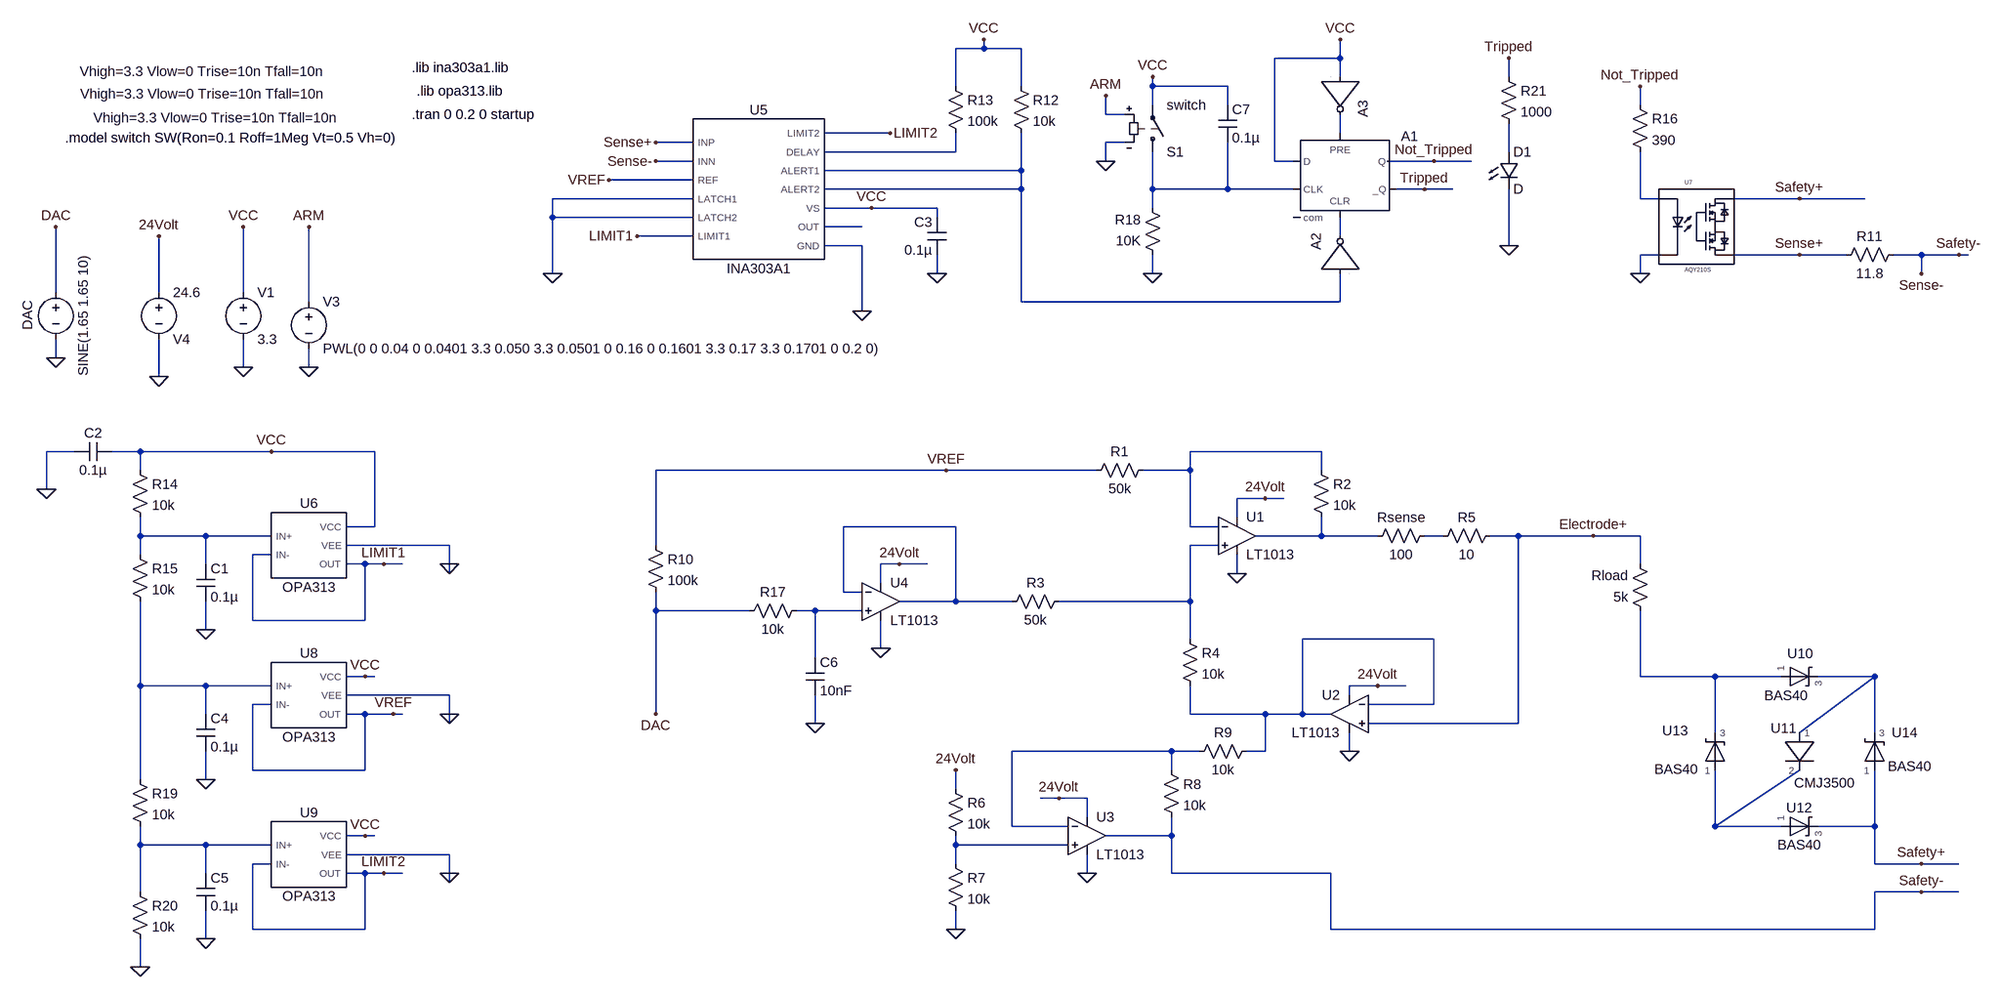
[diagram p0: schematic combined_analog.asc]
combined_analog.asc, the LTspice schematic file:
Version 4.1
SHEET 1 1880 880
WIRE -160 -768 -160 -784
WIRE -160 -768 -208 -768
WIRE -96 -768 -160 -768
WIRE 448 -752 448 -784
WIRE 448 -752 336 -752
WIRE 448 -720 448 -752
WIRE 736 -720 736 -752
WIRE -208 -704 -208 -768
WIRE -96 -704 -96 -768
WIRE 128 -704 128 -720
WIRE 256 -704 128 -704
WIRE 128 -672 128 -704
WIRE 256 -672 256 -704
WIRE 960 -672 960 -704
WIRE 48 -656 48 -688
WIRE 80 -656 48 -656
WIRE -320 -624 -432 -624
WIRE 448 -624 448 -656
WIRE -656 -608 -720 -608
WIRE 80 -608 48 -608
WIRE -208 -592 -208 -624
WIRE -208 -592 -432 -592
WIRE 736 -592 736 -640
WIRE -656 -576 -720 -576
WIRE 48 -576 48 -608
WIRE 336 -576 336 -752
WIRE 368 -576 336 -576
WIRE 608 -576 528 -576
WIRE 672 -576 608 -576
WIRE -96 -560 -96 -624
WIRE -96 -560 -432 -560
WIRE -656 -544 -800 -544
WIRE -96 -528 -96 -560
WIRE -96 -528 -432 -528
WIRE 128 -528 128 -592
WIRE 256 -528 256 -608
WIRE 256 -528 128 -528
WIRE 368 -528 256 -528
WIRE 592 -528 544 -528
WIRE 640 -528 592 -528
WIRE -656 -512 -896 -512
WIRE 960 -512 960 -592
WIRE 992 -512 960 -512
WIRE 1232 -512 1120 -512
WIRE 1344 -512 1232 -512
WIRE -352 -496 -432 -496
WIRE -240 -496 -352 -496
WIRE 128 -496 128 -528
WIRE -896 -480 -896 -512
WIRE -656 -480 -896 -480
WIRE -240 -480 -240 -496
WIRE -368 -464 -432 -464
WIRE -656 -448 -752 -448
WIRE 448 -448 448 -480
WIRE -368 -432 -432 -432
WIRE 736 -432 736 -528
WIRE 992 -416 960 -416
WIRE 1232 -416 1120 -416
WIRE 1312 -416 1232 -416
WIRE 1440 -416 1392 -416
WIRE 1504 -416 1440 -416
WIRE 1520 -416 1504 -416
WIRE -896 -384 -896 -480
WIRE -240 -384 -240 -416
WIRE 128 -384 128 -416
WIRE 960 -384 960 -416
WIRE 1440 -384 1440 -416
WIRE -1744 -352 -1744 -464
WIRE -1568 -352 -1568 -448
WIRE -1424 -352 -1424 -464
WIRE -1312 -336 -1312 -464
WIRE -96 -336 -96 -528
WIRE 448 -336 448 -384
WIRE 448 -336 -96 -336
WIRE -368 -320 -368 -432
WIRE -1744 -240 -1744 -272
WIRE -1424 -224 -1424 -272
WIRE -1312 -224 -1312 -256
WIRE -1568 -208 -1568 -272
WIRE -1712 -80 -1760 -80
WIRE -1600 -80 -1648 -80
WIRE -1376 -80 -1600 -80
WIRE -1200 -80 -1376 -80
WIRE 416 -80 192 -80
WIRE -1600 -48 -1600 -80
WIRE -224 -48 -720 -48
WIRE 32 -48 -224 -48
WIRE 192 -48 192 -80
WIRE 192 -48 112 -48
WIRE 416 -48 416 -80
WIRE -1760 -16 -1760 -80
WIRE 320 0 272 0
WIRE 352 0 320 0
WIRE 272 32 272 0
WIRE -1200 48 -1200 -80
WIRE -1200 48 -1248 48
WIRE -208 48 -400 48
WIRE 192 48 192 -48
WIRE 240 48 192 48
WIRE -1600 64 -1600 32
WIRE -1488 64 -1600 64
WIRE -1376 64 -1488 64
WIRE 416 64 416 32
WIRE 416 64 304 64
WIRE 512 64 416 64
WIRE 624 64 592 64
WIRE 752 64 704 64
WIRE 880 64 752 64
WIRE 960 64 880 64
WIRE -1072 80 -1248 80
WIRE -720 80 -720 -48
WIRE 240 80 192 80
WIRE -1600 96 -1600 64
WIRE -1376 96 -1408 96
WIRE -1488 112 -1488 64
WIRE -1216 112 -1248 112
WIRE -1184 112 -1216 112
WIRE -1152 112 -1184 112
WIRE -1072 112 -1072 80
WIRE -304 112 -336 112
WIRE -256 112 -304 112
WIRE 960 112 960 64
WIRE -1072 128 -1072 112
WIRE 272 128 272 96
WIRE -336 144 -336 112
WIRE -400 160 -400 48
WIRE -368 160 -400 160
WIRE -208 176 -208 48
WIRE -208 176 -304 176
WIRE -112 176 -208 176
WIRE 192 176 192 80
WIRE 192 176 -32 176
WIRE -720 192 -720 160
WIRE -560 192 -720 192
WIRE -448 192 -480 192
WIRE -368 192 -448 192
WIRE -1408 208 -1408 96
WIRE -1216 208 -1216 112
WIRE -1216 208 -1408 208
WIRE -1488 224 -1488 176
WIRE 192 240 192 176
WIRE 608 240 384 240
WIRE -336 256 -336 208
WIRE -448 272 -448 192
WIRE -1216 304 -1248 304
WIRE -1200 304 -1216 304
WIRE 960 304 960 192
WIRE 1088 304 960 304
WIRE 1200 304 1088 304
WIRE 1360 304 1264 304
WIRE -1600 320 -1600 176
WIRE -1488 320 -1600 320
WIRE -1376 320 -1488 320
WIRE 512 320 464 320
WIRE 560 320 512 320
WIRE -1072 336 -1248 336
WIRE 464 336 464 320
WIRE -1376 352 -1408 352
WIRE 608 352 608 240
WIRE 608 352 496 352
WIRE -1488 368 -1488 320
WIRE -1216 368 -1248 368
WIRE -1168 368 -1216 368
WIRE -1152 368 -1168 368
WIRE -1072 368 -1072 336
WIRE -720 368 -720 192
WIRE 192 368 192 320
WIRE 320 368 192 368
WIRE 384 368 384 240
WIRE 384 368 320 368
WIRE 432 368 384 368
WIRE -1072 384 -1072 368
WIRE -448 384 -448 336
WIRE 752 384 752 64
WIRE 752 384 496 384
WIRE 1088 400 1088 304
WIRE 1232 400 1360 304
WIRE 1360 400 1360 304
WIRE 160 432 -112 432
WIRE 208 432 160 432
WIRE 320 432 320 368
WIRE 320 432 288 432
WIRE 464 432 464 400
WIRE -1408 464 -1408 352
WIRE -1216 464 -1216 368
WIRE -1216 464 -1408 464
WIRE 160 464 160 432
WIRE -1600 480 -1600 320
WIRE -1488 480 -1488 432
WIRE -208 496 -208 464
WIRE -32 512 -64 512
WIRE 16 512 -32 512
WIRE 16 544 16 512
WIRE -112 560 -112 432
WIRE -16 560 -112 560
WIRE 1088 560 1088 464
WIRE 1088 560 1232 464
WIRE 1200 560 1088 560
WIRE 1360 560 1360 464
WIRE 1360 560 1264 560
WIRE -1216 576 -1248 576
WIRE -1200 576 -1216 576
WIRE 160 576 160 544
WIRE 160 576 48 576
WIRE -1600 592 -1600 560
WIRE -1488 592 -1600 592
WIRE -1376 592 -1488 592
WIRE -208 592 -208 576
WIRE -16 592 -208 592
WIRE -1072 608 -1248 608
WIRE -1376 624 -1408 624
WIRE -208 624 -208 592
WIRE 1360 624 1360 560
WIRE 1440 624 1360 624
WIRE 1504 624 1440 624
WIRE -1488 640 -1488 592
WIRE -1216 640 -1248 640
WIRE -1184 640 -1216 640
WIRE -1152 640 -1184 640
WIRE -1072 640 -1072 608
WIRE 16 640 16 608
WIRE 160 640 160 576
WIRE 432 640 160 640
WIRE -1072 656 -1072 640
WIRE -1600 672 -1600 592
WIRE 1440 672 1360 672
WIRE 1504 672 1440 672
WIRE -1408 736 -1408 624
WIRE -1216 736 -1216 640
WIRE -1216 736 -1408 736
WIRE -208 736 -208 704
WIRE 432 736 432 640
WIRE 1360 736 1360 672
WIRE 1360 736 432 736
WIRE -1488 752 -1488 704
WIRE -1600 800 -1600 752
FLAG 272 128 0
FLAG 464 432 0
FLAG -1744 -240 0
FLAG 16 640 0
FLAG -208 736 0
FLAG -1568 -208 0
FLAG -1568 -448 24Volt
FLAG 320 0 24Volt
FLAG 512 320 24Volt
FLAG -32 512 24Volt
FLAG -336 256 0
FLAG -368 -320 0
FLAG -352 -496 VCC
FLAG -1424 -224 0
FLAG -1424 -464 VCC
FLAG -160 -784 VCC
FLAG -720 -608 Sense+
FLAG -720 -576 Sense-
FLAG -800 -544 VREF
FLAG -1072 112 0
FLAG -1760 -16 0
FLAG -1376 -80 VCC
FLAG -240 -384 0
FLAG -1312 -224 0
FLAG 736 -432 0
FLAG -1168 368 VREF
FLAG -1072 368 0
FLAG -1072 640 0
FLAG -1600 800 0
FLAG -1488 224 0
FLAG -1488 480 0
FLAG -1488 752 0
FLAG -1216 576 VCC
FLAG -1216 304 VCC
FLAG -1184 112 LIMIT1
FLAG -1184 640 LIMIT2
FLAG -752 -448 LIMIT1
FLAG -320 -624 LIMIT2
FLAG 1232 -512 Safety+
FLAG 1504 -416 Safety-
FLAG 1232 -416 Sense+
FLAG 1440 -384 Sense-
FLAG -304 112 24Volt
FLAG -224 -48 VREF
FLAG -208 464 24Volt
FLAG -448 384 0
FLAG 1440 624 Safety+
FLAG 1440 672 Safety-
FLAG -896 -384 0
FLAG -1744 -464 DAC
FLAG -720 368 DAC
FLAG 448 -784 VCC
FLAG 608 -576 Not_Tripped
FLAG 48 -688 ARM
FLAG -1312 -464 ARM
FLAG 592 -528 Tripped
FLAG 736 -752 Tripped
FLAG 960 -704 Not_Tripped
FLAG 960 -384 0
FLAG 880 64 Electrode+
FLAG 48 -576 0
FLAG 128 -720 VCC
FLAG 128 -384 0
SYMBOL res 128 -64 R90
WINDOW 0 0 56 VBottom 2
WINDOW 3 32 56 VTop 2
SYMATTR InstName R1
SYMATTR Value 50k
SYMBOL res 400 -64 R0
SYMATTR InstName R2
SYMATTR Value 10k
SYMBOL res 608 48 R90
WINDOW 0 0 56 VBottom 2
WINDOW 3 32 56 VTop 2
SYMATTR InstName Rsense
SYMATTR Value 100
SYMBOL res -16 160 R90
WINDOW 0 0 56 VBottom 2
WINDOW 3 32 56 VTop 2
SYMATTR InstName R3
SYMATTR Value 50k
SYMBOL res 176 224 R0
SYMATTR InstName R4
SYMATTR Value 10k
SYMBOL res 976 208 R180
WINDOW 0 36 76 Left 2
WINDOW 3 36 40 Left 2
SYMATTR InstName Rload
SYMATTR Value 5k
SYMBOL voltage -1744 -368 R0
WINDOW 0 -32 56 VBottom 2
WINDOW 3 32 56 VTop 2
WINDOW 123 0 0 Left 0
WINDOW 39 0 0 Left 0
SYMATTR InstName DAC
SYMATTR Value SINE(1.65 1.65 10)
SYMBOL OpAmps\\LT1013 272 0 R0
SYMATTR InstName U1
SYMBOL OpAmps\\LT1013 464 304 M0
SYMATTR InstName U2
SYMBOL res 720 48 R90
WINDOW 0 0 56 VBottom 2
WINDOW 3 32 56 VTop 2
SYMATTR InstName R5
SYMATTR Value 10
SYMBOL OpAmps\\LT1013 16 512 R0
SYMATTR InstName U3
SYMBOL res -224 480 R0
SYMATTR InstName R6
SYMATTR Value 10k
SYMBOL res -224 608 R0
SYMATTR InstName R7
SYMATTR Value 10k
SYMBOL res 144 448 R0
SYMATTR InstName R8
SYMATTR Value 10k
SYMBOL res 304 416 R90
WINDOW 0 0 56 VBottom 2
WINDOW 3 32 56 VTop 2
SYMATTR InstName R9
SYMATTR Value 10k
SYMBOL OpAmps\\LT1013 -336 112 R0
SYMATTR InstName U4
SYMBOL res -736 64 R0
SYMATTR InstName R10
SYMATTR Value 100k
SYMBOL voltage -1568 -368 R0
WINDOW 0 24 96 Left 2
WINDOW 3 24 16 Left 2
WINDOW 123 0 0 Left 0
WINDOW 39 0 0 Left 0
SYMATTR InstName V4
SYMATTR Value 24.6
SYMBOL res 1408 -432 R90
WINDOW 0 0 56 VBottom 2
WINDOW 3 32 56 VTop 2
SYMATTR InstName R11
SYMATTR Value 11.8
SYMBOL GVS\\INA303A1 -544 -528 R0
SYMATTR InstName U5
SYMBOL voltage -1424 -368 R0
WINDOW 123 0 0 Left 0
WINDOW 39 0 0 Left 0
SYMATTR InstName V1
SYMATTR Value 3.3
SYMBOL res -112 -720 R0
SYMATTR InstName R12
SYMATTR Value 10k
SYMBOL res -224 -720 R0
SYMATTR InstName R13
SYMATTR Value 100k
SYMBOL GVS\\OPA313 -1312 80 R0
SYMATTR InstName U6
SYMBOL res -1616 -64 R0
SYMATTR InstName R14
SYMATTR Value 10k
SYMBOL res -1616 80 R0
SYMATTR InstName R15
SYMATTR Value 10k
SYMBOL cap -1504 112 R0
SYMATTR InstName C1
SYMATTR Value 0.1µ
SYMBOL cap -1648 -96 R90
WINDOW 0 0 32 VBottom 2
WINDOW 3 32 32 VTop 2
SYMATTR InstName C2
SYMATTR Value 0.1µ
SYMBOL cap -224 -416 R180
WINDOW 0 24 56 Left 2
WINDOW 3 24 8 Left 2
SYMATTR InstName C3
SYMATTR Value 0.1µ
SYMBOL voltage -1312 -352 R0
WINDOW 123 0 0 Left 0
WINDOW 39 0 0 Left 0
SYMATTR InstName V3
SYMATTR Value PWL(0 0 0.04 0 0.0401 3.3 0.050 3.3 0.0501 0 0.16 0 0.1601 3.3 0.17 3.3 0.1701 0 0.2 0)
SYMBOL GVS\\AQY210S 1056 -464 R0
SYMATTR InstName U7
SYMBOL res 944 -688 R0
SYMATTR InstName R16
SYMATTR Value 390
SYMBOL GVS\\OPA313 -1312 336 R0
SYMATTR InstName U8
SYMBOL GVS\\OPA313 -1312 608 R0
SYMATTR InstName U9
SYMBOL res -1616 464 R0
SYMATTR InstName R19
SYMATTR Value 10k
SYMBOL res -1616 656 R0
SYMATTR InstName R20
SYMATTR Value 10k
SYMBOL cap -1504 368 R0
SYMATTR InstName C4
SYMATTR Value 0.1µ
SYMBOL cap -1504 640 R0
SYMATTR InstName C5
SYMATTR Value 0.1µ
SYMBOL LED 720 -592 R0
SYMATTR InstName D1
SYMBOL res 720 -736 R0
SYMATTR InstName R21
SYMATTR Value 1000
SYMBOL res -464 176 R90
WINDOW 0 0 56 VBottom 2
WINDOW 3 32 56 VTop 2
SYMATTR InstName R17
SYMATTR Value 10k
SYMBOL cap -464 272 R0
SYMATTR InstName C6
SYMATTR Value 10nF
SYMBOL CMJ3500 1232 432 R0
WINDOW 0 -27 -24 Bottom 2
WINDOW 3 43 38 Top 2
SYMATTR InstName U11
SYMBOL BAS40 1232 304 R270
WINDOW 0 23 1 VTop 2
WINDOW 3 -17 -23 VBottom 2
SYMATTR InstName U10
SYMBOL BAS40 1232 560 R270
WINDOW 0 16 0 VTop 2
WINDOW 3 -16 0 VBottom 2
SYMATTR InstName U12
SYMBOL BAS40 1088 432 R180
WINDOW 0 68 20 Top 2
WINDOW 3 66 -15 Bottom 2
SYMATTR InstName U13
SYMBOL BAS40 1360 432 R180
WINDOW 0 -52 16 Top 2
WINDOW 3 -60 -10 Bottom 2
SYMATTR InstName U14
SYMBOL Digital\\dflop 448 -624 R0
WINDOW 3 -2150 -67 Left 2
SYMATTR Value Vhigh=3.3 Vlow=0 Trise=10n Tfall=10n
SYMATTR InstName A1
SYMBOL Digital\\inv 384 -384 R270
WINDOW 3 345 -2087 VRight 2
SYMATTR Value Vhigh=3.3 Vlow=0 Trise=10n Tfall=10n
SYMATTR InstName A2
SYMBOL Digital\\inv 512 -720 R90
WINDOW 3 70 1773 VRight 2
SYMATTR Value Vhigh=3.3 Vlow=0 Trise=10n Tfall=10n
SYMATTR InstName A3
SYMBOL sw 128 -576 M180
SYMATTR InstName S1
SYMATTR Value switch
SYMBOL res 144 -400 R180
WINDOW 0 36 76 Left 2
WINDOW 3 36 40 Left 2
SYMATTR InstName R18
SYMATTR Value 10K
SYMBOL cap 240 -672 R0
SYMATTR InstName C7
SYMATTR Value 0.1µ
TEXT -1136 -656 Left 2 !.tran 0 0.2 0 startup
TEXT -1136 -736 Left 2 !.lib ina303a1.lib
TEXT -1128 -696 Left 2 !.lib opa313.lib
TEXT -1728 -616 Left 2 !.model switch SW(Ron=0.1 Roff=1Meg Vt=0.5 Vh=0)

The netlist it stands for:
* combined_analog.asc
R1 N009 VREF 50k
R2 N009 N012 10k
Rsense N013 N012 100
R3 N014 N010 50k
R4 N014 N016 10k
Rload N017 Electrode+ 5k
V§DAC DAC 0 SINE(1.65 1.65 10)
X§U1 N014 N009 24Volt 0 N012 LT1013  ; pins In+ In- V+ V- OUT
X§U2 Electrode+ N016 24Volt 0 N016 LT1013  ; pins In+ In- V+ V- OUT
R5 Electrode+ N013 10
X§U3 N023 N020 24Volt 0 Safety- LT1013  ; pins In+ In- V+ V- OUT
R6 24Volt N023 10k
R7 N023 0 10k
R8 N020 Safety- 10k
R9 N016 N020 10k
X§U4 N015 N010 24Volt 0 N010 LT1013  ; pins In+ In- V+ V- OUT
R10 VREF DAC 100k
V4 24Volt 0 24.6
R11 Safety- Sense+ 11.8
X§U5 Sense+ Safety- VREF 0 0 LIMIT1 LIMIT2 N002 N004 N004 VCC N007 0 INA303A1  ; pins INP INN REF LATCH1 LATCH2 LIMIT1 LIMIT2 DELAY ALERT1 ALERT2 VS OUT GND
V1 VCC 0 3.3
R12 VCC N004 10k
R13 VCC N002 100k
X§U6 N011 LIMIT1 VCC 0 LIMIT1 OPA313  ; pins IN+ IN- VCC VEE OUT
R14 VCC N011 10k
R15 N011 N019 10k
C1 N011 0 0.1µ
C2 VCC 0 0.1µ
C3 0 VCC 0.1µ
V3 ARM 0 PWL(0 0 0.04 0 0.0401 3.3 0.050 3.3 0.0501 0 0.16 0 0.1601 3.3 0.17 3.3 0.1701 0 0.2 0)
X§U7 N006 0 Sense+ Safety+ AQY210S  ; pins 1 2 3 4
R16 Not_Tripped N006 390
X§U8 N019 VREF VCC 0 VREF OPA313  ; pins IN+ IN- VCC VEE OUT
X§U9 N022 LIMIT2 VCC 0 LIMIT2 OPA313  ; pins IN+ IN- VCC VEE OUT
R19 N019 N022 10k
R20 N022 0 10k
C4 N019 0 0.1µ
C5 N022 0 0.1µ
D1 N003 0 D
R21 Tripped N003 1000
R17 N015 DAC 10k
C6 N015 0 10nF
X§U11 N018 N021 CMJ3500  ; pins 1 2
X§U10 N017 N018 BAS40  ; pins 1 3
X§U12 N021 Safety+ BAS40  ; pins 1 3
X§U13 N021 N017 BAS40  ; pins 1 3
X§U14 Safety+ N018 BAS40  ; pins 1 3
A1 VCC 0 N005 N001 N008 Tripped Not_Tripped 0 DFLOP Vhigh=3.3 Vlow=0 Trise=10n Tfall=10n
A2 N004 0 0 0 0 N008 0 0 BUF Vhigh=3.3 Vlow=0 Trise=10n Tfall=10n
A3 VCC 0 0 0 0 N001 0 0 BUF Vhigh=3.3 Vlow=0 Trise=10n Tfall=10n
S1 N005 VCC ARM 0 switch
R18 0 N005 10K
C7 VCC N005 0.1µ
.model D D
.lib standard.dio
.tran 0 0.2 0 startup
.lib ina303a1.lib
.lib opa313.lib
.model switch SW(Ron=0.1 Roff=1Meg Vt=0.5 Vh=0)
.lib LTC.lib
.lib ina303a1.lib
.lib opa313.lib
.lib AQY210S_LTspice.lib
.lib CMJ3500.LIB
.lib BAS40.prm
.backanno
.end